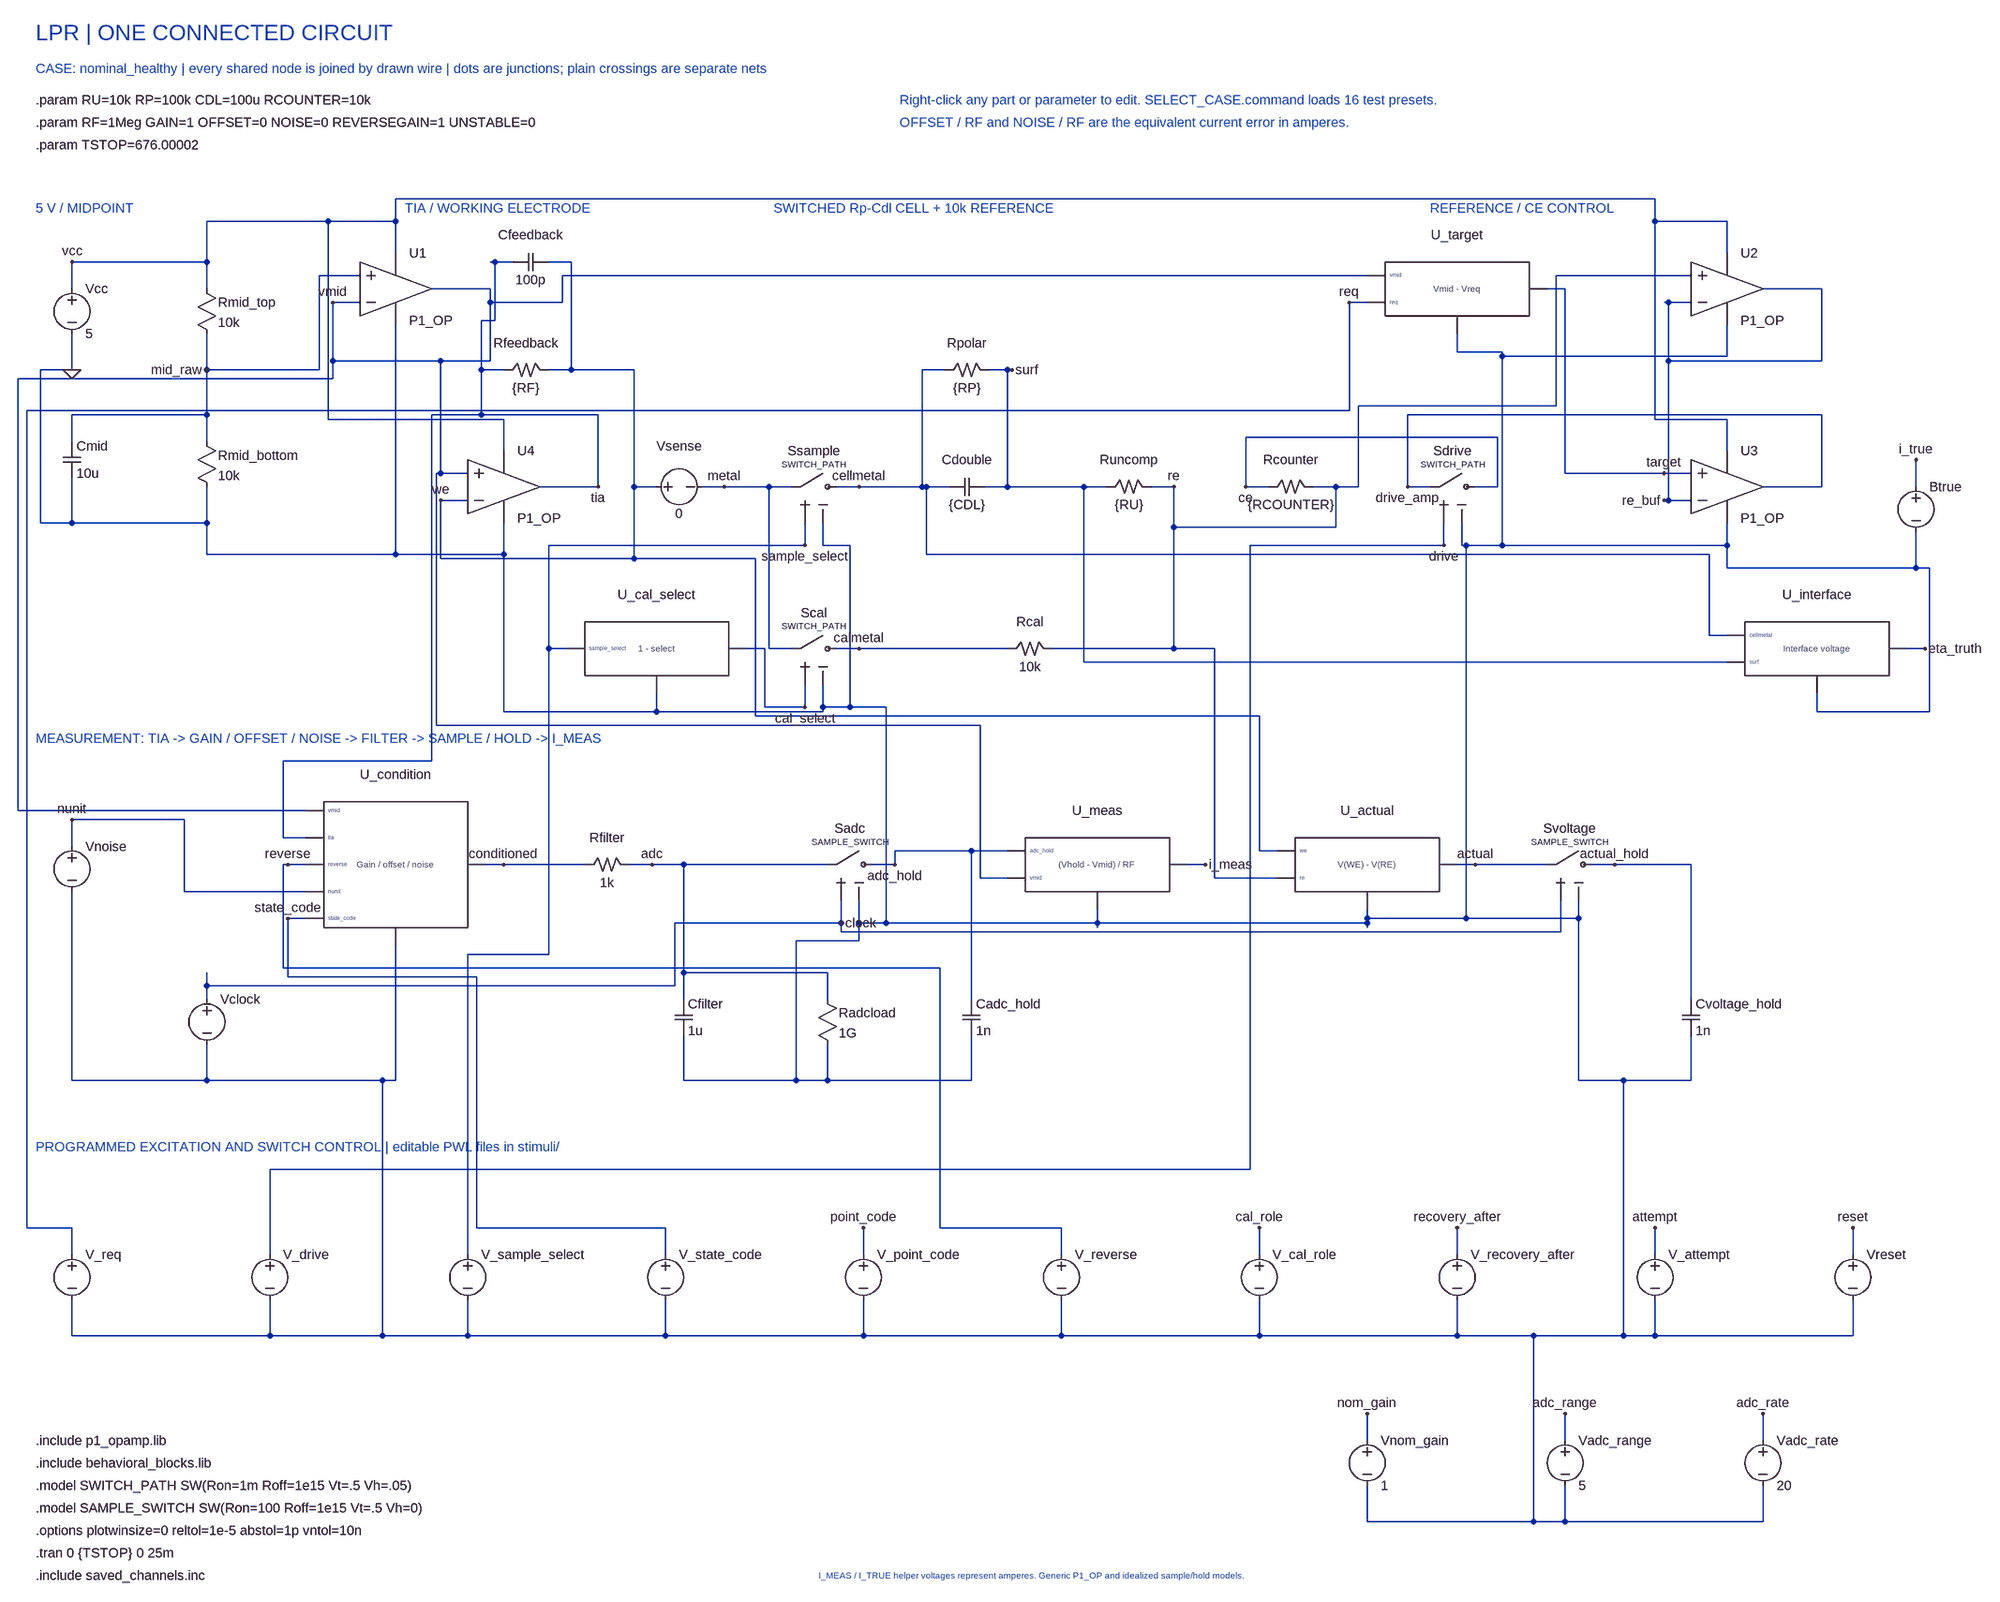
[diagram p0: schematic LPR_Unified.asc]
LPR_Unified.asc, the LTspice schematic file:
Version 4
SHEET 1 3680 2928
TEXT 64 24 Left 4 ;LPR | ONE CONNECTED CIRCUIT
TEXT 64 88 Left 2 ;CASE: nominal_healthy | every shared node is joined by drawn wire | dots are junctions; plain crossings are separate nets
TEXT 64 144 Left 2 !.param RU=10k RP=100k CDL=100u RCOUNTER=10k
TEXT 64 184 Left 2 !.param RF=1Meg GAIN=1 OFFSET=0 NOISE=0 REVERSEGAIN=1 UNSTABLE=0
TEXT 64 224 Left 2 !.param TSTOP=676.00002
TEXT 1600 144 Left 2 ;Right-click any part or parameter to edit. SELECT_CASE.command loads 16 test presets.
TEXT 1600 184 Left 2 ;OFFSET / RF and NOISE / RF are the equivalent current error in amperes.
TEXT 64 336 Left 2 ;5 V / MIDPOINT
TEXT 720 336 Left 2 ;TIA / WORKING ELECTRODE
TEXT 1376 336 Left 2 ;SWITCHED Rp-Cdl CELL + 10k REFERENCE
TEXT 2544 336 Left 2 ;REFERENCE / CE CONTROL
TEXT 64 1280 Left 2 ;MEASUREMENT: TIA -> GAIN / OFFSET / NOISE -> FILTER -> SAMPLE / HOLD -> I_MEAS
TEXT 64 2048 Left 2 ;PROGRAMMED EXCITATION AND SWITCH CONTROL | editable PWL files in stimuli/
TEXT 64 2592 Left 2 !.include p1_opamp.lib
TEXT 64 2632 Left 2 !.include behavioral_blocks.lib
TEXT 64 2672 Left 2 !.model SWITCH_PATH SW(Ron=1m Roff=1e15 Vt=.5 Vh=.05)
TEXT 64 2712 Left 2 !.model SAMPLE_SWITCH SW(Ron=100 Roff=1e15 Vt=.5 Vh=0)
TEXT 64 2752 Left 2 !.options plotwinsize=0 reltol=1e-5 abstol=1p vntol=10n
TEXT 64 2792 Left 2 !.tran 0 {TSTOP} 0 25m
TEXT 64 2832 Left 2 !.include saved_channels.inc
TEXT 1456 2832 Left 1 ;I_MEAS / I_TRUE helper voltages represent amperes. Generic P1_OP and idealized sample/hold models.
WIRE 128 432 128 480
WIRE 128 560 128 624
WIRE 368 432 368 480
WIRE 368 560 368 624
WIRE 368 704 368 752
WIRE 368 832 368 896
WIRE 128 704 128 752
WIRE 128 816 128 896
WIRE 592 456 640 456
WIRE 592 504 640 504
WIRE 704 360 704 416
WIRE 704 544 704 600
WIRE 768 480 872 480
WIRE 784 808 832 808
WIRE 784 856 832 856
WIRE 896 712 896 768
WIRE 896 896 896 952
WIRE 960 832 1064 832
WIRE 856 624 896 624
WIRE 976 624 1016 624
WIRE 872 432 880 432
WIRE 880 432 912 432
WIRE 976 432 1016 432
WIRE 1128 832 1168 832
WIRE 1248 832 1288 832
WIRE 1368 832 1408 832
WIRE 1488 832 1528 832
WIRE 1432 896 1432 936
WIRE 1464 896 1464 936
WIRE 1640 624 1680 624
WIRE 1760 624 1792 624
WIRE 1792 624 1800 624
WIRE 1648 832 1688 832
WIRE 1752 832 1792 832
WIRE 1928 832 1968 832
WIRE 2048 832 2088 832
WIRE 2216 832 2256 832
WIRE 2336 832 2376 832
WIRE 2504 832 2544 832
WIRE 2624 832 2664 832
WIRE 2568 896 2568 936
WIRE 2600 896 2600 936
WIRE 2960 808 3008 808
WIRE 2960 856 2968 856
WIRE 2968 856 3008 856
WIRE 3072 712 3072 768
WIRE 3072 896 3072 936
WIRE 3072 936 3072 952
WIRE 3136 832 3240 832
WIRE 2960 456 3008 456
WIRE 2960 504 2968 504
WIRE 2968 504 3008 504
WIRE 3072 360 3072 416
WIRE 3072 544 3072 600
WIRE 3136 480 3240 480
WIRE 2400 456 2432 456
WIRE 2400 504 2432 504
WIRE 2752 480 2784 480
WIRE 2592 560 2592 592
WIRE 1368 1120 1408 1120
WIRE 1488 1120 1528 1120
WIRE 1432 1184 1432 1224
WIRE 1464 1184 1464 1224
WIRE 1752 1120 1792 1120
WIRE 1872 1120 1912 1120
WIRE 976 1120 1008 1120
WIRE 1328 1120 1360 1120
WIRE 1168 1200 1168 1232
WIRE 128 1424 128 1472
WIRE 128 1552 128 1616
WIRE 512 1408 544 1408
WIRE 512 1456 544 1456
WIRE 512 1504 544 1504
WIRE 512 1552 544 1552
WIRE 512 1600 544 1600
WIRE 864 1504 896 1504
WIRE 704 1648 704 1680
WIRE 1000 1504 1040 1504
WIRE 1120 1504 1160 1504
WIRE 1216 1696 1216 1744
WIRE 1216 1808 1216 1888
WIRE 1472 1696 1472 1744
WIRE 1472 1824 1472 1888
WIRE 1432 1504 1472 1504
WIRE 1552 1504 1592 1504
WIRE 1496 1568 1496 1608
WIRE 1528 1568 1528 1608
WIRE 1728 1696 1728 1744
WIRE 1728 1808 1728 1888
WIRE 1760 1480 1792 1480
WIRE 1760 1528 1792 1528
WIRE 2112 1504 2144 1504
WIRE 1952 1584 1952 1608
WIRE 1952 1608 1952 1616
WIRE 2240 1480 2272 1480
WIRE 2240 1528 2272 1528
WIRE 2592 1504 2624 1504
WIRE 2432 1584 2432 1600
WIRE 2432 1600 2432 1608
WIRE 2432 1608 2432 1616
WIRE 2712 1504 2752 1504
WIRE 2832 1504 2872 1504
WIRE 2776 1568 2776 1608
WIRE 2808 1568 2808 1600
WIRE 2808 1600 2808 1608
WIRE 3008 1696 3008 1744
WIRE 3008 1808 3008 1888
WIRE 3040 1096 3072 1096
WIRE 3040 1144 3072 1144
WIRE 3392 1120 3424 1120
WIRE 3232 1200 3232 1232
WIRE 3408 784 3408 832
WIRE 3408 912 3408 976
WIRE 368 1696 368 1720
WIRE 368 1720 368 1744
WIRE 368 1824 368 1888
WIRE 128 2192 128 2240
WIRE 128 2320 128 2384
WIRE 480 2192 480 2240
WIRE 480 2320 480 2384
WIRE 832 2192 832 2240
WIRE 832 2320 832 2384
WIRE 1184 2192 1184 2240
WIRE 1184 2320 1184 2384
WIRE 1536 2192 1536 2240
WIRE 1536 2320 1536 2384
WIRE 1888 2192 1888 2240
WIRE 1888 2320 1888 2384
WIRE 2240 2192 2240 2240
WIRE 2240 2320 2240 2384
WIRE 2592 2192 2592 2240
WIRE 2592 2320 2592 2384
WIRE 2944 2192 2944 2240
WIRE 2944 2320 2944 2384
WIRE 3296 2192 3296 2240
WIRE 3296 2320 3296 2384
WIRE 2432 2544 2432 2592
WIRE 2432 2672 2432 2736
WIRE 2784 2544 2784 2592
WIRE 2784 2672 2784 2736
WIRE 3136 2544 3136 2592
WIRE 3136 2672 3136 2736
WIRE 2624 1504 2712 1504
WIRE 3008 1504 3008 1696
WIRE 2872 1504 3008 1504
WIRE 1360 1120 1360 1224
WIRE 1360 1224 1432 1224
WIRE 1528 1120 1752 1120
WIRE 2664 744 2664 832
WIRE 2216 744 2664 744
WIRE 2216 744 2216 832
WIRE 896 1504 1000 1504
WIRE 480 2088 480 2192
WIRE 480 2088 2224 2088
WIRE 2224 936 2224 2088
WIRE 2224 936 2568 936
WIRE 3240 704 3240 832
WIRE 2504 704 3240 704
WIRE 2504 704 2504 832
WIRE 328 1552 512 1552
WIRE 328 1424 328 1552
WIRE 128 1424 328 1424
WIRE 48 2192 128 2192
WIRE 48 696 48 2192
WIRE 48 696 2400 696
WIRE 2400 504 2400 696
WIRE 1672 2192 1888 2192
WIRE 1672 1688 1672 2192
WIRE 504 1688 1672 1688
WIRE 504 1504 504 1688
WIRE 504 1504 512 1504
WIRE 848 2192 1184 2192
WIRE 848 1704 848 2192
WIRE 512 1704 848 1704
WIRE 512 1600 512 1704
WIRE 2784 480 2784 808
WIRE 2784 808 2960 808
WIRE 1592 1480 1728 1480
WIRE 1728 1480 1760 1480
WIRE 1592 1480 1592 1504
WIRE 1728 1480 1728 1696
WIRE 368 1720 1200 1720
WIRE 1200 1608 1200 1720
WIRE 1200 1608 1496 1608
WIRE 2776 1608 2776 1624
WIRE 1496 1624 2776 1624
WIRE 1496 1608 1496 1624
WIRE 1288 832 1368 832
WIRE 1368 832 1368 1120
WIRE 2968 504 2968 608
WIRE 2968 608 2968 856
WIRE 3240 480 3240 608
WIRE 2968 608 3240 608
WIRE 976 936 976 1120
WIRE 976 936 1432 936
WIRE 832 1664 832 2192
WIRE 832 1664 976 1664
WIRE 976 1120 976 1664
WIRE 1216 1504 1216 1696
WIRE 1160 1504 1216 1504
WIRE 1216 1504 1432 1504
WIRE 1216 1696 1472 1696
WIRE 1528 832 1640 832
WIRE 1640 832 1648 832
WIRE 1640 624 1640 832
WIRE 3040 952 3040 1096
WIRE 1648 952 3040 952
WIRE 1648 832 1648 952
WIRE 368 624 368 704
WIRE 128 704 368 704
WIRE 568 456 592 456
WIRE 568 456 568 624
WIRE 368 624 568 624
WIRE 1792 624 1792 832
WIRE 1792 832 1928 832
WIRE 1928 1144 3040 1144
WIRE 1928 832 1928 1144
WIRE 856 624 856 704
WIRE 856 704 1064 704
WIRE 1064 704 1064 832
WIRE 880 432 880 536
WIRE 856 536 880 536
WIRE 856 536 856 624
WIRE 504 1456 512 1456
WIRE 504 1320 504 1456
WIRE 504 1320 768 1320
WIRE 768 704 768 1320
WIRE 768 704 856 704
WIRE 2376 832 2376 904
WIRE 2088 904 2376 904
WIRE 2088 832 2088 904
WIRE 1912 1120 2088 1120
WIRE 2088 904 2088 1120
WIRE 2160 1528 2240 1528
WIRE 2160 1120 2160 1528
WIRE 2088 1120 2160 1120
WIRE 2768 456 2960 456
WIRE 2768 456 2768 688
WIRE 2416 688 2768 688
WIRE 2416 688 2416 832
WIRE 2376 832 2416 832
WIRE 1128 832 1128 960
WIRE 784 960 1128 960
WIRE 784 856 784 960
WIRE 1016 624 1128 624
WIRE 1128 624 1128 832
WIRE 1016 432 1016 624
WIRE 2240 1240 2240 1480
WIRE 1344 1240 2240 1240
WIRE 1344 960 1344 1240
WIRE 1128 960 1344 960
WIRE 872 480 872 504
WIRE 872 504 872 608
WIRE 592 608 784 608
WIRE 784 608 872 608
WIRE 592 504 592 608
WIRE 784 608 784 808
WIRE 32 1408 512 1408
WIRE 32 640 32 1408
WIRE 32 640 592 640
WIRE 592 608 592 640
WIRE 1744 1528 1760 1528
WIRE 1744 1256 1744 1528
WIRE 776 1256 1744 1256
WIRE 776 808 776 1256
WIRE 776 808 784 808
WIRE 1000 456 2400 456
WIRE 1000 456 1000 504
WIRE 872 504 1000 504
WIRE 128 432 368 432
WIRE 368 360 584 360
WIRE 584 360 704 360
WIRE 368 360 368 432
WIRE 584 712 896 712
WIRE 584 360 584 712
WIRE 2944 712 3072 712
WIRE 2944 320 2944 360
WIRE 2944 360 2944 712
WIRE 704 320 2944 320
WIRE 704 320 704 360
WIRE 2944 360 3072 360
WIRE 72 896 128 896
WIRE 72 624 72 896
WIRE 72 624 128 624
WIRE 128 896 368 896
WIRE 368 952 704 952
WIRE 704 952 896 952
WIRE 368 896 368 952
WIRE 704 600 704 952
WIRE 896 1232 1168 1232
WIRE 896 952 896 1232
WIRE 1464 1224 1464 1232
WIRE 1168 1232 1464 1232
WIRE 1464 936 1512 936
WIRE 1512 936 1512 1224
WIRE 1464 1224 1512 1224
WIRE 1528 1608 1576 1608
WIRE 1576 1224 1576 1608
WIRE 1512 1224 1576 1224
WIRE 1416 1888 1472 1888
WIRE 1416 1640 1416 1888
WIRE 1416 1640 1528 1640
WIRE 1528 1608 1528 1640
WIRE 1216 1888 1416 1888
WIRE 1472 1888 1728 1888
WIRE 1576 1608 1952 1608
WIRE 1952 1608 2432 1608
WIRE 2432 1600 2608 1600
WIRE 2608 1600 2808 1600
WIRE 2808 1888 2888 1888
WIRE 2888 1888 3008 1888
WIRE 2808 1608 2808 1888
WIRE 2888 2384 2944 2384
WIRE 2888 1888 2888 2384
WIRE 2592 2384 2728 2384
WIRE 2728 2384 2888 2384
WIRE 2728 2736 2784 2736
WIRE 2728 2384 2728 2736
WIRE 2432 2736 2728 2736
WIRE 2784 2736 3136 2736
WIRE 2240 2384 2592 2384
WIRE 1888 2384 2240 2384
WIRE 1536 2384 1888 2384
WIRE 1184 2384 1536 2384
WIRE 832 2384 1184 2384
WIRE 480 2384 680 2384
WIRE 680 2384 832 2384
WIRE 128 2384 480 2384
WIRE 2944 2384 3296 2384
WIRE 368 1888 680 1888
WIRE 680 1888 680 2384
WIRE 704 1680 704 1888
WIRE 680 1888 704 1888
WIRE 128 1616 128 1888
WIRE 128 1888 368 1888
WIRE 2600 936 2608 936
WIRE 2608 936 2608 1600
WIRE 2592 592 2672 592
WIRE 2672 592 2672 600
WIRE 2672 600 2672 936
WIRE 2608 936 2672 936
WIRE 2672 600 3072 600
WIRE 2672 936 3072 936
WIRE 3072 976 3408 976
WIRE 3072 952 3072 976
WIRE 3232 1232 3432 1232
WIRE 3432 976 3432 1232
WIRE 3408 976 3432 976
FLAG 128 432 vcc
FLAG 128 624 0
FLAG 368 624 mid_raw
FLAG 592 504 vmid
FLAG 784 856 we
FLAG 1064 832 tia
FLAG 1288 832 metal
FLAG 1528 832 cellmetal
FLAG 1432 936 sample_select
FLAG 1800 624 surf
FLAG 2088 832 re
FLAG 2216 832 ce
FLAG 2504 832 drive_amp
FLAG 2568 936 drive
FLAG 2960 808 target
FLAG 2960 856 re_buf
FLAG 2400 504 req
FLAG 1528 1120 calmetal
FLAG 1432 1224 cal_select
FLAG 128 1424 nunit
FLAG 512 1504 reverse
FLAG 512 1600 state_code
FLAG 896 1504 conditioned
FLAG 1160 1504 adc
FLAG 1592 1504 adc_hold
FLAG 1496 1608 clock
FLAG 2144 1504 i_meas
FLAG 2624 1504 actual
FLAG 2872 1504 actual_hold
FLAG 3424 1120 eta_truth
FLAG 3408 784 i_true
FLAG 1536 2192 point_code
FLAG 2240 2192 cal_role
FLAG 2592 2192 recovery_after
FLAG 2944 2192 attempt
FLAG 3296 2192 reset
FLAG 2432 2544 nom_gain
FLAG 2784 2544 adc_range
FLAG 3136 2544 adc_rate
SYMBOL voltage 128 464 R0
SYMATTR InstName Vcc
SYMATTR Value 5
SYMBOL res 352 464 R0
SYMATTR InstName Rmid_top
SYMATTR Value 10k
SYMBOL res 352 736 R0
SYMATTR InstName Rmid_bottom
SYMATTR Value 10k
SYMBOL cap 112 752 R0
SYMATTR InstName Cmid
SYMATTR Value 10u
SYMBOL LPR_OPAMP 704 480 R0
SYMATTR InstName U1
SYMATTR Value P1_OP
SYMBOL LPR_OPAMP 896 832 R0
SYMATTR InstName U4
SYMATTR Value P1_OP
SYMBOL LPR_RH 896 624 R0
SYMATTR InstName Rfeedback
SYMATTR Value {RF}
SYMBOL LPR_CH 912 432 R0
SYMATTR InstName Cfeedback
SYMATTR Value 100p
SYMBOL LPR_VH 1168 832 R0
SYMATTR InstName Vsense
SYMATTR Value 0
SYMBOL LPR_SW_H 1408 832 R0
SYMATTR InstName Ssample
SYMATTR Value SWITCH_PATH
SYMBOL LPR_RH 1680 624 R0
SYMATTR InstName Rpolar
SYMATTR Value {RP}
SYMBOL LPR_CH 1688 832 R0
SYMATTR InstName Cdouble
SYMATTR Value {CDL}
SYMBOL LPR_RH 1968 832 R0
SYMATTR InstName Runcomp
SYMATTR Value {RU}
SYMBOL LPR_RH 2256 832 R0
SYMATTR InstName Rcounter
SYMATTR Value {RCOUNTER}
SYMBOL LPR_SW_H 2544 832 R0
SYMATTR InstName Sdrive
SYMATTR Value SWITCH_PATH
SYMBOL LPR_OPAMP 3072 832 R0
SYMATTR InstName U3
SYMATTR Value P1_OP
SYMBOL LPR_OPAMP 3072 480 R0
SYMATTR InstName U2
SYMATTR Value P1_OP
SYMBOL LPR_TARGET 2592 480 R0
WINDOW 3 24 96 Invisible 0
SYMATTR InstName U_target
SYMATTR Value LPR_TARGET
SYMBOL LPR_SW_H 1408 1120 R0
SYMATTR InstName Scal
SYMATTR Value SWITCH_PATH
SYMBOL LPR_RH 1792 1120 R0
SYMATTR InstName Rcal
SYMATTR Value 10k
SYMBOL LPR_SELECT 1168 1120 R0
WINDOW 3 24 96 Invisible 0
SYMATTR InstName U_cal_select
SYMATTR Value LPR_SELECT
SYMBOL voltage 128 1456 R0
WINDOW 3 24 96 Invisible 0
SYMATTR InstName Vnoise
SYMATTR Value PWL FILE=noise.txt
SYMBOL LPR_CONDITION 704 1504 R0
WINDOW 3 24 96 Invisible 0
SYMATTR InstName U_condition
SYMATTR Value LPR_CONDITION
SYMBOL LPR_RH 1040 1504 R0
SYMATTR InstName Rfilter
SYMATTR Value 1k
SYMBOL cap 1200 1744 R0
SYMATTR InstName Cfilter
SYMATTR Value 1u
SYMBOL res 1456 1728 R0
SYMATTR InstName Radcload
SYMATTR Value 1G
SYMBOL LPR_SW_H 1472 1504 R0
SYMATTR InstName Sadc
SYMATTR Value SAMPLE_SWITCH
SYMBOL cap 1712 1744 R0
SYMATTR InstName Cadc_hold
SYMATTR Value 1n
SYMBOL LPR_CURRENT 1952 1504 R0
WINDOW 3 24 96 Invisible 0
SYMATTR InstName U_meas
SYMATTR Value LPR_CURRENT
SYMBOL LPR_VOLTAGE 2432 1504 R0
WINDOW 3 24 96 Invisible 0
SYMATTR InstName U_actual
SYMATTR Value LPR_VOLTAGE
SYMBOL LPR_SW_H 2752 1504 R0
SYMATTR InstName Svoltage
SYMATTR Value SAMPLE_SWITCH
SYMBOL cap 2992 1744 R0
SYMATTR InstName Cvoltage_hold
SYMATTR Value 1n
SYMBOL LPR_ETA 3232 1120 R0
WINDOW 3 24 96 Invisible 0
SYMATTR InstName U_interface
SYMATTR Value LPR_ETA
SYMBOL bv 3408 816 R0
WINDOW 3 24 96 Invisible 0
SYMATTR InstName Btrue
SYMATTR Value V=I(Vsense)
SYMBOL voltage 368 1728 R0
WINDOW 3 24 96 Invisible 0
SYMATTR InstName Vclock
SYMATTR Value PULSE(0 1 .04989 10u 10u 100u .05)
SYMBOL voltage 128 2224 R0
WINDOW 3 24 96 Invisible 0
SYMATTR InstName V_req
SYMATTR Value PWL FILE=stimuli/V_req.txt
SYMBOL voltage 480 2224 R0
WINDOW 3 24 96 Invisible 0
SYMATTR InstName V_drive
SYMATTR Value PWL FILE=stimuli/V_drive.txt
SYMBOL voltage 832 2224 R0
WINDOW 3 24 96 Invisible 0
SYMATTR InstName V_sample_select
SYMATTR Value PWL FILE=stimuli/V_sample_select.txt
SYMBOL voltage 1184 2224 R0
WINDOW 3 24 96 Invisible 0
SYMATTR InstName V_state_code
SYMATTR Value PWL FILE=stimuli/V_state_code.txt
SYMBOL voltage 1536 2224 R0
WINDOW 3 24 96 Invisible 0
SYMATTR InstName V_point_code
SYMATTR Value PWL FILE=stimuli/V_point_code.txt
SYMBOL voltage 1888 2224 R0
WINDOW 3 24 96 Invisible 0
SYMATTR InstName V_reverse
SYMATTR Value PWL FILE=stimuli/V_reverse.txt
SYMBOL voltage 2240 2224 R0
WINDOW 3 24 96 Invisible 0
SYMATTR InstName V_cal_role
SYMATTR Value PWL FILE=stimuli/V_cal_role.txt
SYMBOL voltage 2592 2224 R0
WINDOW 3 24 96 Invisible 0
SYMATTR InstName V_recovery_after
SYMATTR Value PWL FILE=stimuli/V_recovery_after.txt
SYMBOL voltage 2944 2224 R0
WINDOW 3 24 96 Invisible 0
SYMATTR InstName V_attempt
SYMATTR Value PWL FILE=stimuli/V_attempt.txt
SYMBOL voltage 3296 2224 R0
WINDOW 3 24 96 Invisible 0
SYMATTR InstName Vreset
SYMATTR Value PWL FILE=stimuli/Vreset.txt
SYMBOL voltage 2432 2576 R0
SYMATTR InstName Vnom_gain
SYMATTR Value 1
SYMBOL voltage 2784 2576 R0
SYMATTR InstName Vadc_range
SYMATTR Value 5
SYMBOL voltage 3136 2576 R0
SYMATTR InstName Vadc_rate
SYMATTR Value 20

The netlist it stands for:
* LPR_Unified.asc
Vcc vcc 0 5
Rmid_top vcc mid_raw 10k
Rmid_bottom mid_raw 0 10k
Cmid mid_raw 0 10u
XU1 mid_raw vmid vcc 0 vmid P1_OP  ; pins IN+ IN- V+ V- OUT
XU4 vmid we vcc 0 tia P1_OP  ; pins IN+ IN- V+ V- OUT
Rfeedback tia we {RF}
Cfeedback tia we 100p
Vsense we metal 0
Ssample metal cellmetal sample_select 0 SWITCH_PATH
Rpolar cellmetal surf {RP}
Cdouble cellmetal surf {CDL}
Runcomp surf re {RU}
Rcounter ce re {RCOUNTER}
Sdrive drive_amp ce drive 0 SWITCH_PATH
XU3 target re_buf vcc 0 drive_amp P1_OP  ; pins IN+ IN- V+ V- OUT
XU2 re re_buf vcc 0 re_buf P1_OP  ; pins IN+ IN- V+ V- OUT
XU_target vmid req target 0 LPR_TARGET  ; pins vmid req target gnd
Scal metal calmetal cal_select 0 SWITCH_PATH
Rcal calmetal re 10k
XU_cal_select sample_select cal_select 0 LPR_SELECT  ; pins sample_select cal_select gnd
Vnoise nunit 0 PWL FILE=noise.txt
XU_condition vmid tia reverse nunit state_code conditioned 0 LPR_CONDITION  ; pins vmid tia reverse nunit state_code conditioned gnd
Rfilter conditioned adc 1k
Cfilter adc 0 1u
Radcload adc 0 1G
Sadc adc adc_hold clock 0 SAMPLE_SWITCH
Cadc_hold adc_hold 0 1n
XU_meas adc_hold vmid i_meas 0 LPR_CURRENT  ; pins adc_hold vmid i_meas gnd
XU_actual we re actual 0 LPR_VOLTAGE  ; pins we re actual gnd
Svoltage actual actual_hold clock 0 SAMPLE_SWITCH
Cvoltage_hold actual_hold 0 1n
XU_interface cellmetal surf eta_truth 0 LPR_ETA  ; pins cellmetal surf eta_truth gnd
Btrue i_true 0 V=I(Vsense)
Vclock clock 0 PULSE(0 1 .04989 10u 10u 100u .05)
V_req req 0 PWL FILE=stimuli/V_req.txt
V_drive drive 0 PWL FILE=stimuli/V_drive.txt
V_sample_select sample_select 0 PWL FILE=stimuli/V_sample_select.txt
V_state_code state_code 0 PWL FILE=stimuli/V_state_code.txt
V_point_code point_code 0 PWL FILE=stimuli/V_point_code.txt
V_reverse reverse 0 PWL FILE=stimuli/V_reverse.txt
V_cal_role cal_role 0 PWL FILE=stimuli/V_cal_role.txt
V_recovery_after recovery_after 0 PWL FILE=stimuli/V_recovery_after.txt
V_attempt attempt 0 PWL FILE=stimuli/V_attempt.txt
Vreset reset 0 PWL FILE=stimuli/Vreset.txt
Vnom_gain nom_gain 0 1
Vadc_range adc_range 0 5
Vadc_rate adc_rate 0 20
* LPR | ONE CONNECTED CIRCUIT
* CASE: nominal_healthy | every shared node is joined by drawn wire | dots are junctions; plain crossings are separate nets
.param RU=10k RP=100k CDL=100u RCOUNTER=10k
.param RF=1Meg GAIN=1 OFFSET=0 NOISE=0 REVERSEGAIN=1 UNSTABLE=0
.param TSTOP=676.00002
* Right-click any part or parameter to edit. SELECT_CASE.command loads 16 test presets.
* OFFSET / RF and NOISE / RF are the equivalent current error in amperes.
* 5 V / MIDPOINT
* TIA / WORKING ELECTRODE
* SWITCHED Rp-Cdl CELL + 10k REFERENCE
* REFERENCE / CE CONTROL
* MEASUREMENT: TIA -> GAIN / OFFSET / NOISE -> FILTER -> SAMPLE / HOLD -> I_MEAS
* PROGRAMMED EXCITATION AND SWITCH CONTROL | editable PWL files in stimuli/
.include p1_opamp.lib
.include behavioral_blocks.lib
.model SWITCH_PATH SW(Ron=1m Roff=1e15 Vt=.5 Vh=.05)
.model SAMPLE_SWITCH SW(Ron=100 Roff=1e15 Vt=.5 Vh=0)
.options plotwinsize=0 reltol=1e-5 abstol=1p vntol=10n
.tran 0 {TSTOP} 0 25m
.include saved_channels.inc
* I_MEAS / I_TRUE helper voltages represent amperes. Generic P1_OP and idealized sample/hold models.
.backanno
.end